# Altium schematic sheet Sheet4.SchDoc
size A3; SheetNumber: 1; SheetTotal: 1
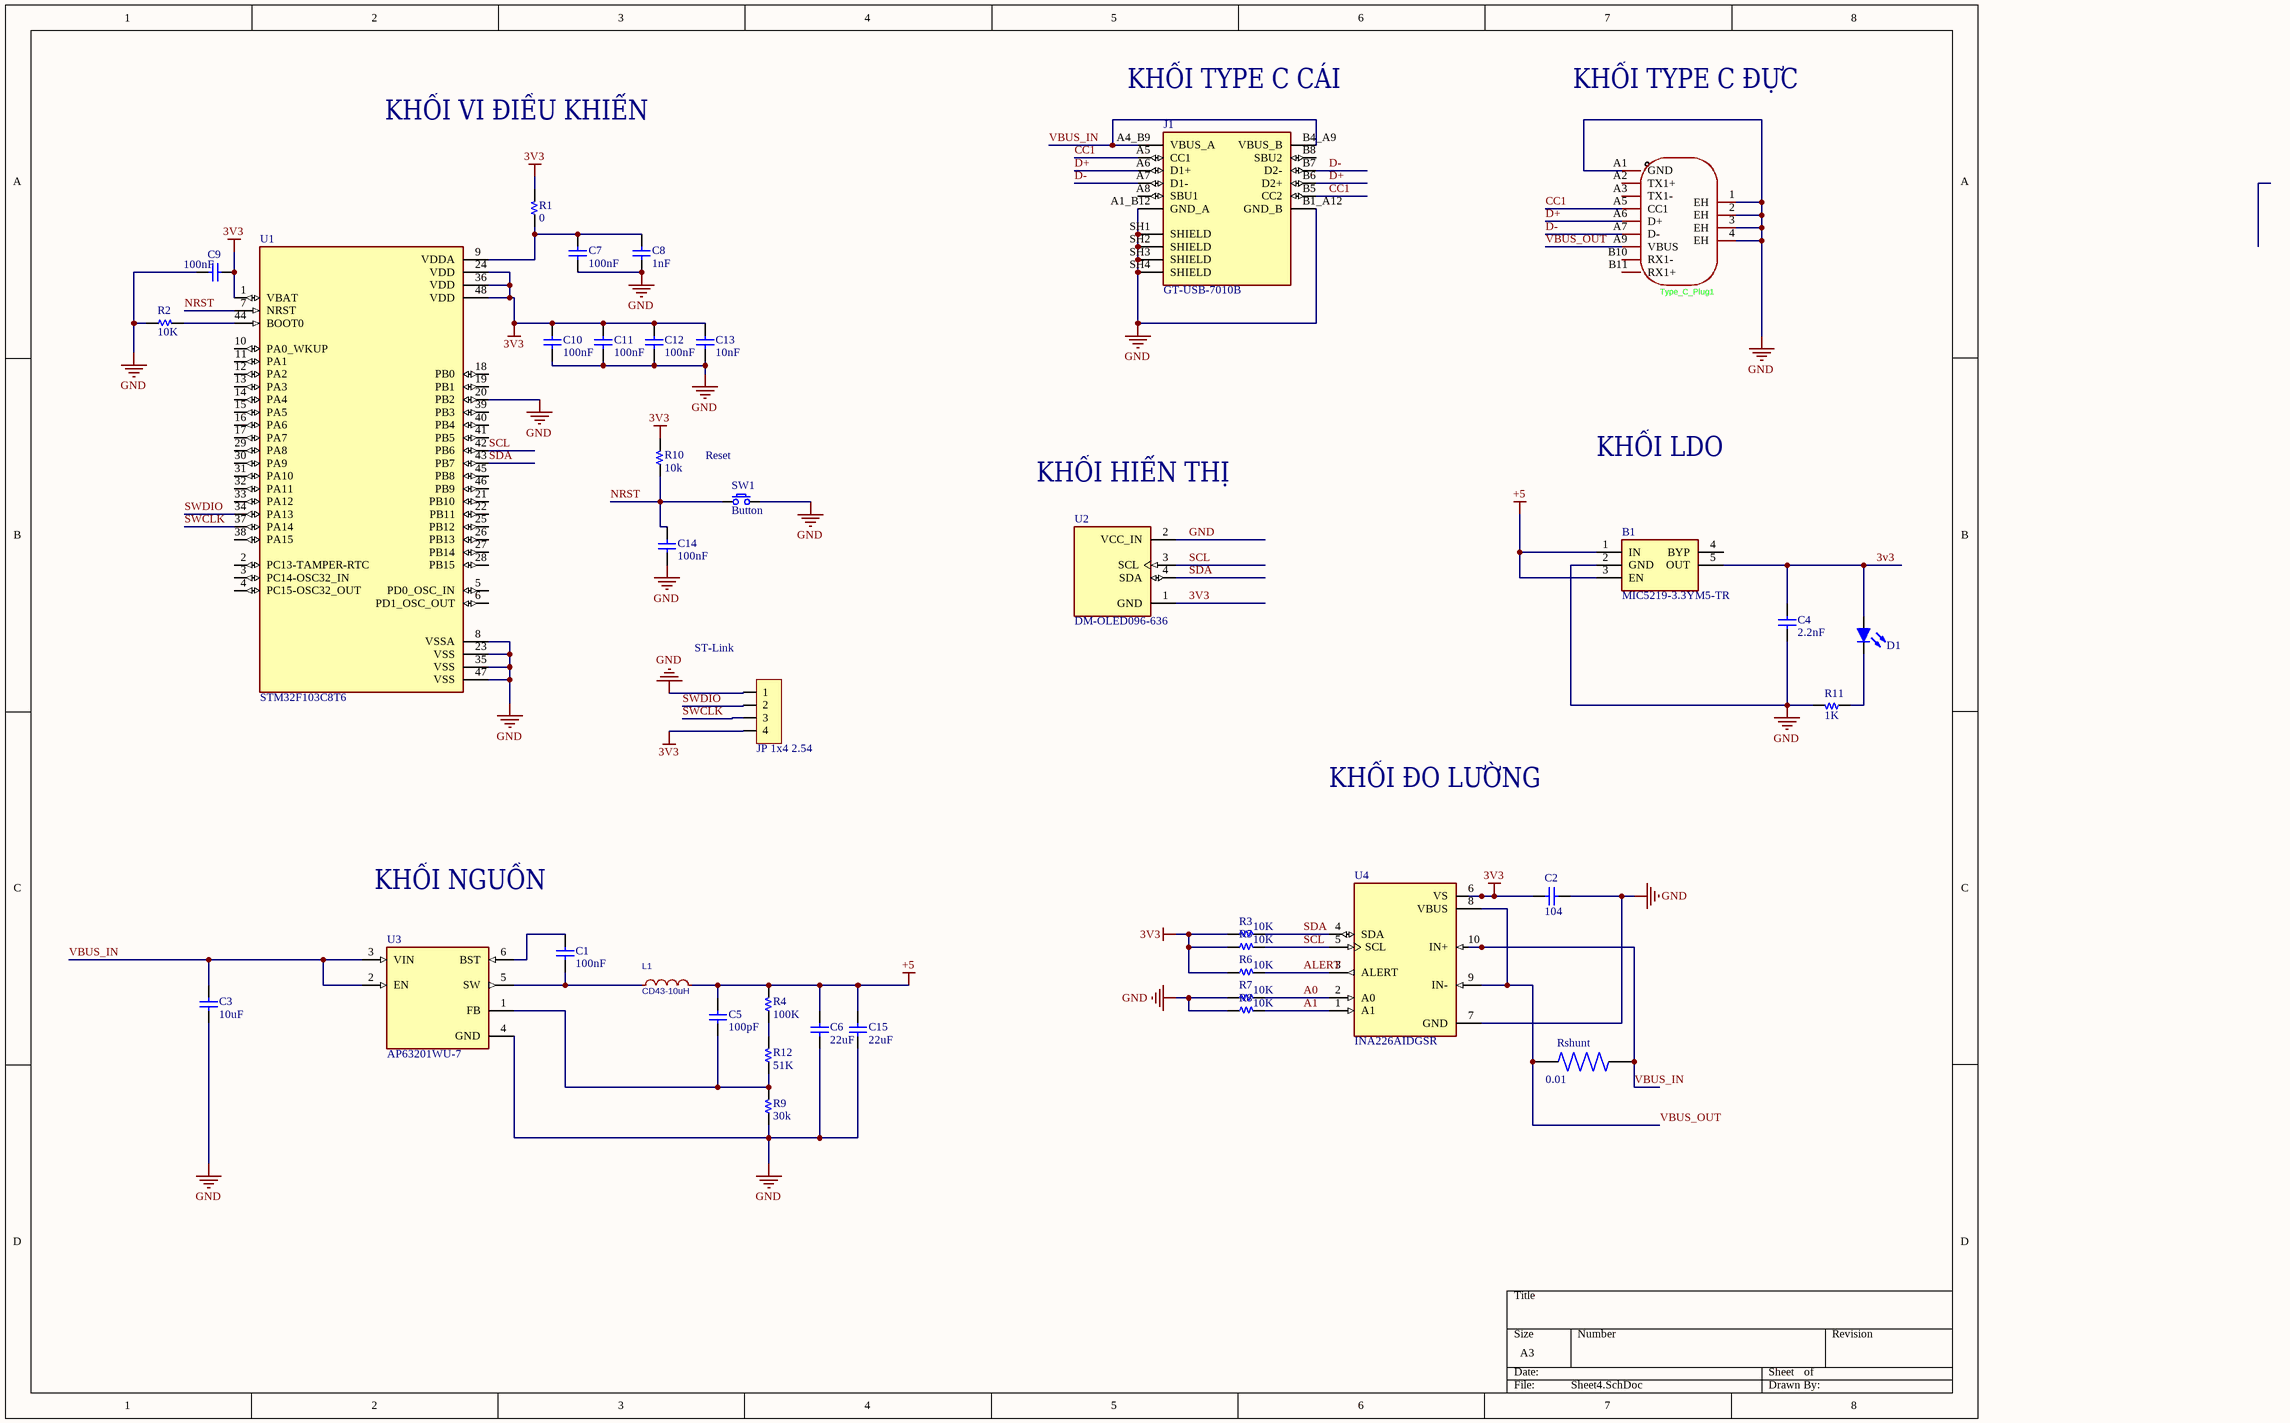
[diagram p0: Sheet4.SchDoc]

## Parts
B1  MIC5219-3.3YM5-TR  [SOT95P280X145-5N]
C1  100nF  [C 0603]
C2  104  [C 0603]
C3  10uF  [C 0603]
C4  2.2nF  [C 0603]
C5  100pF  [C 0603]
C6  22uF  [C 0603]
C7  100nF  [C 0603]
C8  1nF  [C 0603]
C9  100nF  [C 0603]
C10  100nF  [C 0603]
C11  100nF  [C 0603]
C12  100nF  [C 0603]
C13  10nF  [C 0603]
C14  100nF  [C 0603]
C15  22uF  [C 0603]
D1  Led  [Led 0603 - red]  (value not drawn)
J1  GT-USB-7010B  [G-SWITCH_GT-USB-7010B]
JP1  JP 1x4 2.54  [JP 1x4 DC]
L1  CD43-10uH  [IND-SMD_L4.5-W4.0]
R1  0  [R 0603]
R2  10K  [R 0603]
R3  10K  [R 0603]
R4  100K  [R 0603]
R5  10K  [R 0603]
R6  10K  [R 0603]
R7  10K  [R 0603]
R8  10K  [R 0603]
R9  30k  [R 0603]
R10  10k  [R 0603]
R11  1K  [R 0603]
R12  51K  [R 0603]
Rshunt  0.01  [RES_ERJU1TF4700U]
SW1  Button  [SW/2/SMD]
Type_C_Plug1  GT-USB-8016A  [USB-TYPE-C-SMD_GT-USB-8016A]  (value not drawn)
U1  STM32F103C8T6  [QFP50P900X900X160-48N]
U2  DM-OLED096-636  [MODULE_DM-OLED096-636]
U3  AP63201WU-7  [SOP95P280X100-6N]
U4  INA226AIDGSR  [SOP50P490X110-10N]

## Nets
3V3: B1.5(OUT) C2.1 C4.1 C9.2 C10.1 C11.1 C12.1 C13.1 D1.1(A) JP1.4 R1.2 R3.1 R5.1 R6.1 R10.2 U1.1(VBAT) U1.24(VDD) U1.36(VDD) U1.48(VDD) U2.1(GND) U4.6(VS)
+5: B1.1(IN) B1.3(EN) C5.1 C6.1 C15.1 L1.2 R4.2
GND: B1.2(GND) C2.2 C3.2 C4.2 C6.2 C7.2 C8.2 C9.1 C10.2 C11.2 C12.2 C13.2 C14.2 C15.2 J1.A1_B12(GND_A) J1.B1_A12(GND_B) J1.SH1(SHIELD) J1.SH2(SHIELD) J1.SH3(SHIELD) J1.SH4(SHIELD) JP1.1 R2.1 R7.1 R8.1 R9.1 R11.2 SW1.2 Type_C_Plug1.1(EH) Type_C_Plug1.2(EH) Type_C_Plug1.3(EH) Type_C_Plug1.4(EH) Type_C_Plug1.A1(GND) U1.8(VSSA) U1.20(PB2) U1.23(VSS) U1.35(VSS) U1.47(VSS) U2.2(VCC_IN) U3.4(GND) U4.7(GND)
A0: R7.2 U4.2(A0)
A1: R8.2 U4.1(A1)
ALERT: R6.2 U4.3(ALERT)
CC1: J1.A5(CC1) J1.B5(CC2) Type_C_Plug1.A5(CC1)
D+: J1.A6(D1+) J1.B6(D2+) Type_C_Plug1.A6(D+)
D-: J1.A7(D1-) J1.B7(D2-) Type_C_Plug1.A7(D-)
NRST: C14.1 R10.1 SW1.1 U1.7(NRST)
SCL: R5.2 U1.42(PB6) U2.3(SCL) U4.5(SCL)
SDA: R3.2 U1.43(PB7) U2.4(SDA) U4.4(SDA)
SWCLK: JP1.3 U1.37(PA14)
SWDIO: JP1.2 U1.34(PA13)
VBUS_IN: C3.1 J1.A4_B9(VBUS_A) J1.B4_A9(VBUS_B) Rshunt.2 U3.2(EN) U3.3(VIN) U4.10(IN+)
VBUS_OUT: Rshunt.1 Type_C_Plug1.A9(VBUS) U4.8(VBUS) U4.9(IN-)
NetC1_1: C1.1 U3.6(BST)
NetC1_2: C1.2 L1.1 U3.5(SW)
NetC5_2: C5.2 R9.2 R12.1 U3.1(FB)
NetC7_1: C7.1 C8.1 R1.1 U1.9(VDDA)
NetD1_2: D1.2(K) R11.1
NetR2_2: R2.2 U1.44(BOOT0)
NetR4_1: R4.1 R12.2

Not connected (* = marked no-connect by the designer): B1 4(BYP); J1 A8(SBU1) B8(SBU2); Type_C_Plug1 A2(TX1+) A3(TX1-) B10(RX1-) B11(RX1+); U1 2(PC13-TAMPER-RTC) 3(PC14-OSC32_IN) 4(PC15-OSC32_OUT) 5(PD0_OSC_IN) 6(PD1_OSC_OUT) 10(PA0_WKUP) 11(PA1) 12(PA2) 13(PA3) 14(PA4) 15(PA5) 16(PA6) 17(PA7) 18(PB0) 19(PB1) 21(PB10) 22(PB11) 25(PB12) 26(PB13) 27(PB14) 28(PB15) 29(PA8) 30(PA9) 31(PA10) 32(PA11) 33(PA12) 38(PA15) 39(PB3) 40(PB4) 41(PB5) 45(PB8) 46(PB9)

## Notes on the sheet
- (near J1) KHỐI TYPE C CÁI
- KHỐI TYPE C ĐỰC
- KHỐI VI ĐIỀU KHIỂN
- Reset
- KHỐI HIỂN THỊ
- KHỐI LDO
- (near JP1) ST-Link
- KHỐI ĐO LƯỜNG
- KHỐI NGUỒN

## Library data of the parts
B1 = MIC5219-3.3YM5-TR: LDO Regulator Pos 3.3V 0.5A Microchip MIC5219-3.3YM5-TR, LDO Voltage Regulator, 500mA, 3.3 V +/-2%, 2.5  12 Vin, 5-Pin SOT-23; Geometry.Height: 1.45mm; Manufacturer_Name: Microchip; Manufacturer_Part_Number: MIC5219-3.3YM5-TR; Mouser Part Number: 998-MIC5219-3.3YM5TR; Mouser Price/Stock: https://www.mouser.co.uk/ProductDetail/Microchip-Technology/MIC5219-3.3YM5-TR?qs=U6T8BxXiZAWojkIJMtSJlw%3D%3D; Arrow Part Number: MIC5219-3.3YM5-TR; Arrow Price/Stock: https://www.arrow.com/en/products/mic5219-3.3ym5-tr/microchip-technology?utm_currency=USD&region=nac; Datasheet Link: http://www.microchip.com/mymicrochip/filehandler.aspx?ddocname=en579712
C1-C15 = Capacitor NP: Capacitor non-pol
D1 = Led: Typical LED
J1 = GT-USB-7010B: Horizontal Type-C 16P Female SMT; MF: G-switch; SnapEDA_Link: https://www.snapeda.com/parts/GT-USB-7010B/G-switch/view-part/?ref=snap; Package: None; Value: *; MP: GT-USB-7010B; Check_prices: https://www.snapeda.com/parts/GT-USB-7010B/G-switch/view-part/?ref=eda
JP1 = JP 1x4 2.54 Duc Cong: Cắm; Ten_Linh_Kien: Jump Đơn Đực 2.54MM 1x40P Cong Đứng; Don_Vi: Con; Ma_Hang: MH000904; Ghi_Chu: *; Kieu_Chan: *; Chung_Loai: Cắm
L1 = CD43-10uH: AddInBom: yes; ModelId: fc5e8c13a5db48cc9753193df7da3342ÂŽ0819f05c4eef4c71ace90d822a990e87; ModelName: IND-SMD_L4.5-W4.0-H3.2; ModelTransform: 157.48,170.221,0,90,0,0,0,-0.591,0; Symbol: CD43-10UH; Device: CD43-10uH; LCSC Part Name: CD43-10uH; SupplierPart: C9900008796; ManufacturerPart: CD43-10uH; Supplier Footprint: IND-SMD_L4.5-W4.0; JLCPCB Part Class: Extended Part; Supplier: LCSC; ConvertToPcb: yes; FootprintName: IND-SMD_L4.5-W4.0
R1-R12 = Resistor
Rshunt = ERJU1TF4700U: MP: ERJU1TF4700U; Price: None; Package: None; Value: *; Availability: Unavailable
SW1 = SW SPST: Tact switch 2 pin
Type_C_Plug1 = GT-USB-8016A: Manufacturer: G-Switch(品赞); Add into BOM: yes; Connector Type: Type-C; Protocol Standard: USB 2.0; Gender: Male; Number of Contacts: 9P; Number of Ports: 1; Center Height: 0.15mm; Detection color: Black; Symbol: GT-USB-8016A; Device: GT-USB-8016A; LCSC Part Name: Type-C 公 沉板; Supplier Part: C2988371; Manufacturer Part: GT-USB-8016A; Supplier Footprint: SMD; JLCPCB Part Class: Extended Part; Datasheet: https://item.szlcsc.com/datasheet/GT-USB-8016A/3445597.html; Supplier: LCSC; Convert to PCB: yes; Mounting Type: Laminated board; Current Rating-Power: -; Voltage Rating: -; Connect-Disconnect Life: -; Length: 12mm; Operating Temperature: -40℃~+85℃
U1 = STM32F103C8T6: ARM® Cortex®-M3 STM32F1 Microcontroller IC 32-Bit 72MHz 64KB (64K x 8) FLASH 48-LQFP (7x7); MF: STMicroelectronics; SnapEDA_Link: https://www.snapeda.com/parts/STM32F103C8T6/STMicroelectronics/view-part/?ref=snap; Package: LQFP-48 STMicroelectronics; Value: *; MP: STM32F103C8T6; Check_prices: https://www.snapeda.com/parts/STM32F103C8T6/STMicroelectronics/view-part/?ref=eda
U2 = DM-OLED096-636: 0.96â€ 128 X 64 MONOCHROME GRAPHIC OLED DISPLAY MODULE - I2C; SnapEDA_Link: https://www.snapeda.com/parts/DM-OLED096-636/Display+Module/view-part/?ref=snap; Package: Package; Value: *; MF: Display Module; MP: DM-OLED096-636; Check_prices: https://www.snapeda.com/parts/DM-OLED096-636/Display+Module/view-part/?ref=eda
U4 = INA226AIDGSR: 36V, 16-bit, ultra-precise i2c output current/voltage/power monitor w/alert; MF: Texas Instruments; SnapEDA_Link: https://www.snapeda.com/parts/INA226AIDGSR/Texas+Instruments/view-part/?ref=snap; Package: VSSOP-10 Texas Instruments; Value: *; MP: INA226AIDGSR; Check_prices: https://www.snapeda.com/parts/INA226AIDGSR/Texas+Instruments/view-part/?ref=eda
U3 = AP63201WU-7: Package: None; Price: None; Value: *; MP: AP63201WU-7; Availability: Unavailable